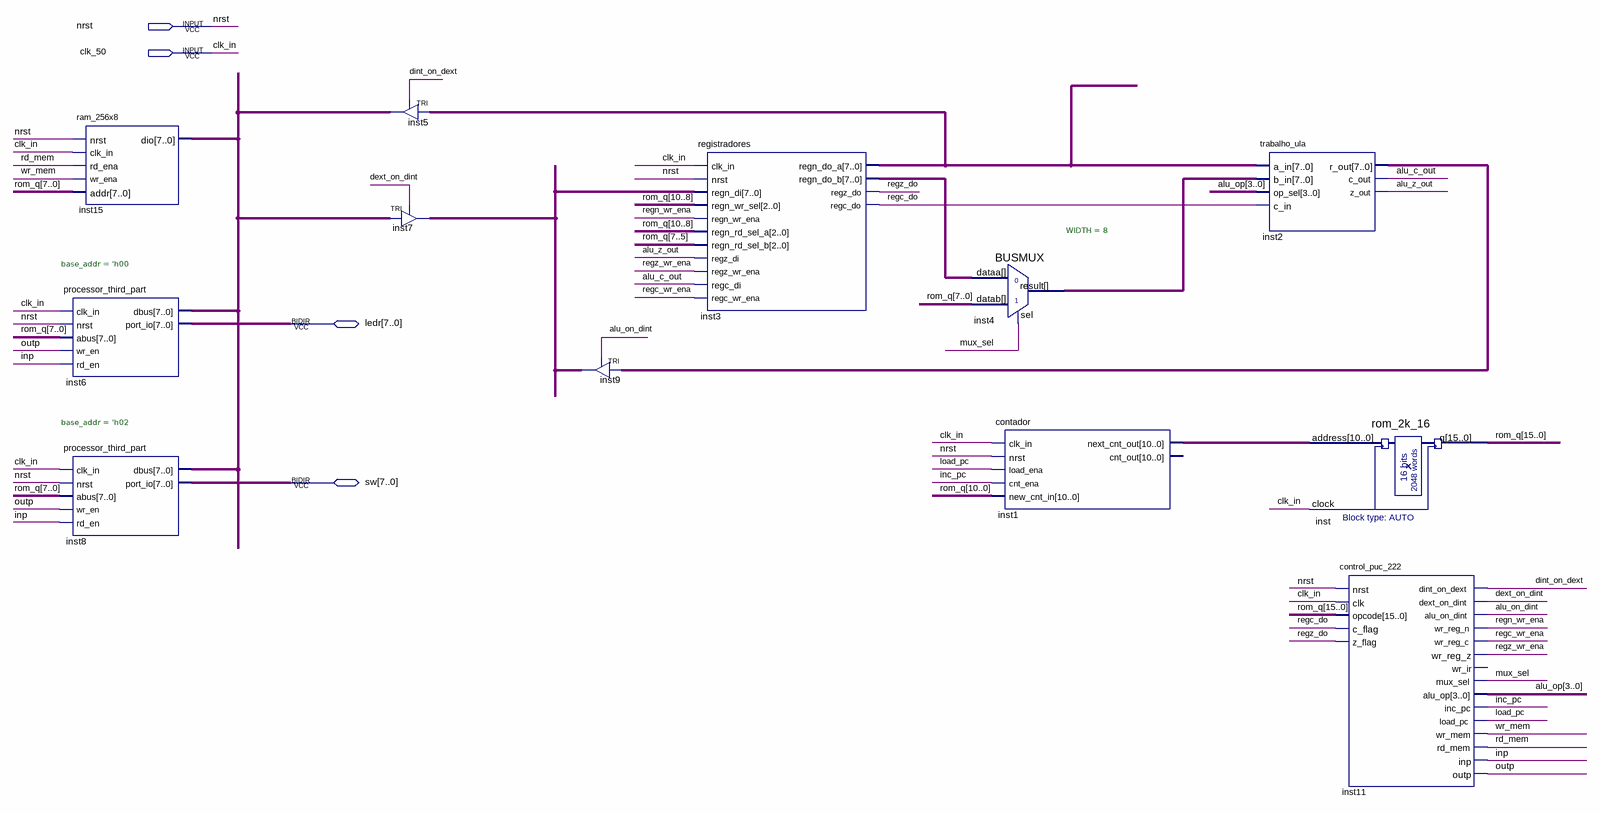
[diagram p0: schematic sheet]
// Quartus schematic projeto_puc_222.bdf as structural Verilog: 12 symbols, 4 pins
module projeto_puc_222 (
  input  nrst,
  input  clk_50,
  inout  [7:0] ledr,
  inout  [7:0] sw
);

  wire alu_c_out, alu_on_dint, alu_z_out, dext_on_dint, dint_on_dext, inc_pc, inp, load_pc, mux_sel, outp,
       rd_mem, regc_do, regc_wr_ena, regn_wr_ena, regz_do, regz_wr_ena, wr_mem;
  wire [3:0] alu_op;
  wire [7:0] inst2_r_out, inst3_regn_do_a, inst3_regn_do_b, inst4_result, inst7_out, inst15_dio;
  wire [10:0] inst1_next_cnt_out;
  wire [15:0] rom_q;

  ram_256x8 inst15 (
    .nrst(nrst), .clk_in(clk_50), .rd_ena(rd_mem), .wr_ena(wr_mem), .addr(rom_q[7:0]), .dio(inst15_dio));
  processor_third_part #(.base_addr('h00)) inst6 (
    .clk_in(clk_50), .nrst(nrst), .abus(rom_q[7:0]), .wr_en(outp), .rd_en(inp), .dbus(inst15_dio),
    .port_io(ledr));
  processor_third_part #(.base_addr('h02)) inst8 (
    .clk_in(clk_50), .nrst(nrst), .abus(rom_q[7:0]), .wr_en(outp), .rd_en(inp), .dbus(inst15_dio),
    .port_io(sw));
  TRI inst5[7:0] (.IN(inst3_regn_do_a), .OE(dint_on_dext), .OUT(inst15_dio));
  TRI inst7[7:0] (.IN(inst15_dio), .OE(dext_on_dint), .OUT(inst7_out));
  TRI inst9[7:0] (.IN(inst2_r_out), .OE(alu_on_dint), .OUT(inst7_out));
  registradores inst3 (
    .clk_in(clk_50), .nrst(nrst), .regn_di(inst7_out), .regn_wr_sel(rom_q[10:8]), .regn_wr_ena(regn_wr_ena),
    .regn_rd_sel_a(rom_q[10:8]), .regn_rd_sel_b(rom_q[7:5]), .regz_di(alu_z_out), .regz_wr_ena(regz_wr_ena),
    .regc_di(alu_c_out), .regc_wr_ena(regc_wr_ena), .regn_do_a(inst3_regn_do_a), .regn_do_b(inst3_regn_do_b),
    .regz_do(regz_do), .regc_do(regc_do));
  BUSMUX #(.WIDTH(8)) inst4 (.datab(rom_q[7:0]), .sel(mux_sel), .dataa(inst3_regn_do_b), .result(inst4_result));
  contador inst1 (
    .clk_in(clk_50), .nrst(nrst), .load_ena(load_pc), .cnt_ena(inc_pc), .new_cnt_in(rom_q[10:0]),
    .next_cnt_out(inst1_next_cnt_out));  // open: cnt_out
  trabalho_ula inst2 (
    .a_in(inst3_regn_do_a), .b_in(inst4_result), .op_sel(alu_op), .c_in(regc_do), .r_out(inst2_r_out),
    .c_out(alu_c_out), .z_out(alu_z_out));
  rom_2k_16 inst (.address(inst1_next_cnt_out), .clock(clk_50), .q(rom_q));
  control_puc_222 inst11 (
    .nrst(nrst), .clk(clk_50), .opcode(rom_q), .c_flag(regc_do), .z_flag(regz_do),
    .dint_on_dext(dint_on_dext), .dext_on_dint(dext_on_dint), .alu_on_dint(alu_on_dint),
    .wr_reg_n(regn_wr_ena), .wr_reg_c(regc_wr_ena), .wr_reg_z(regz_wr_ena), .mux_sel(mux_sel),
    .alu_op(alu_op), .inc_pc(inc_pc), .load_pc(load_pc), .wr_mem(wr_mem), .rd_mem(rd_mem), .inp(inp),
    .outp(outp));  // open: wr_ir

  // Other names for the same wires on the sheet: clk_in = clk_50
endmodule
